# EAGLE design DuressBadge (EAGLE 9.6.2)
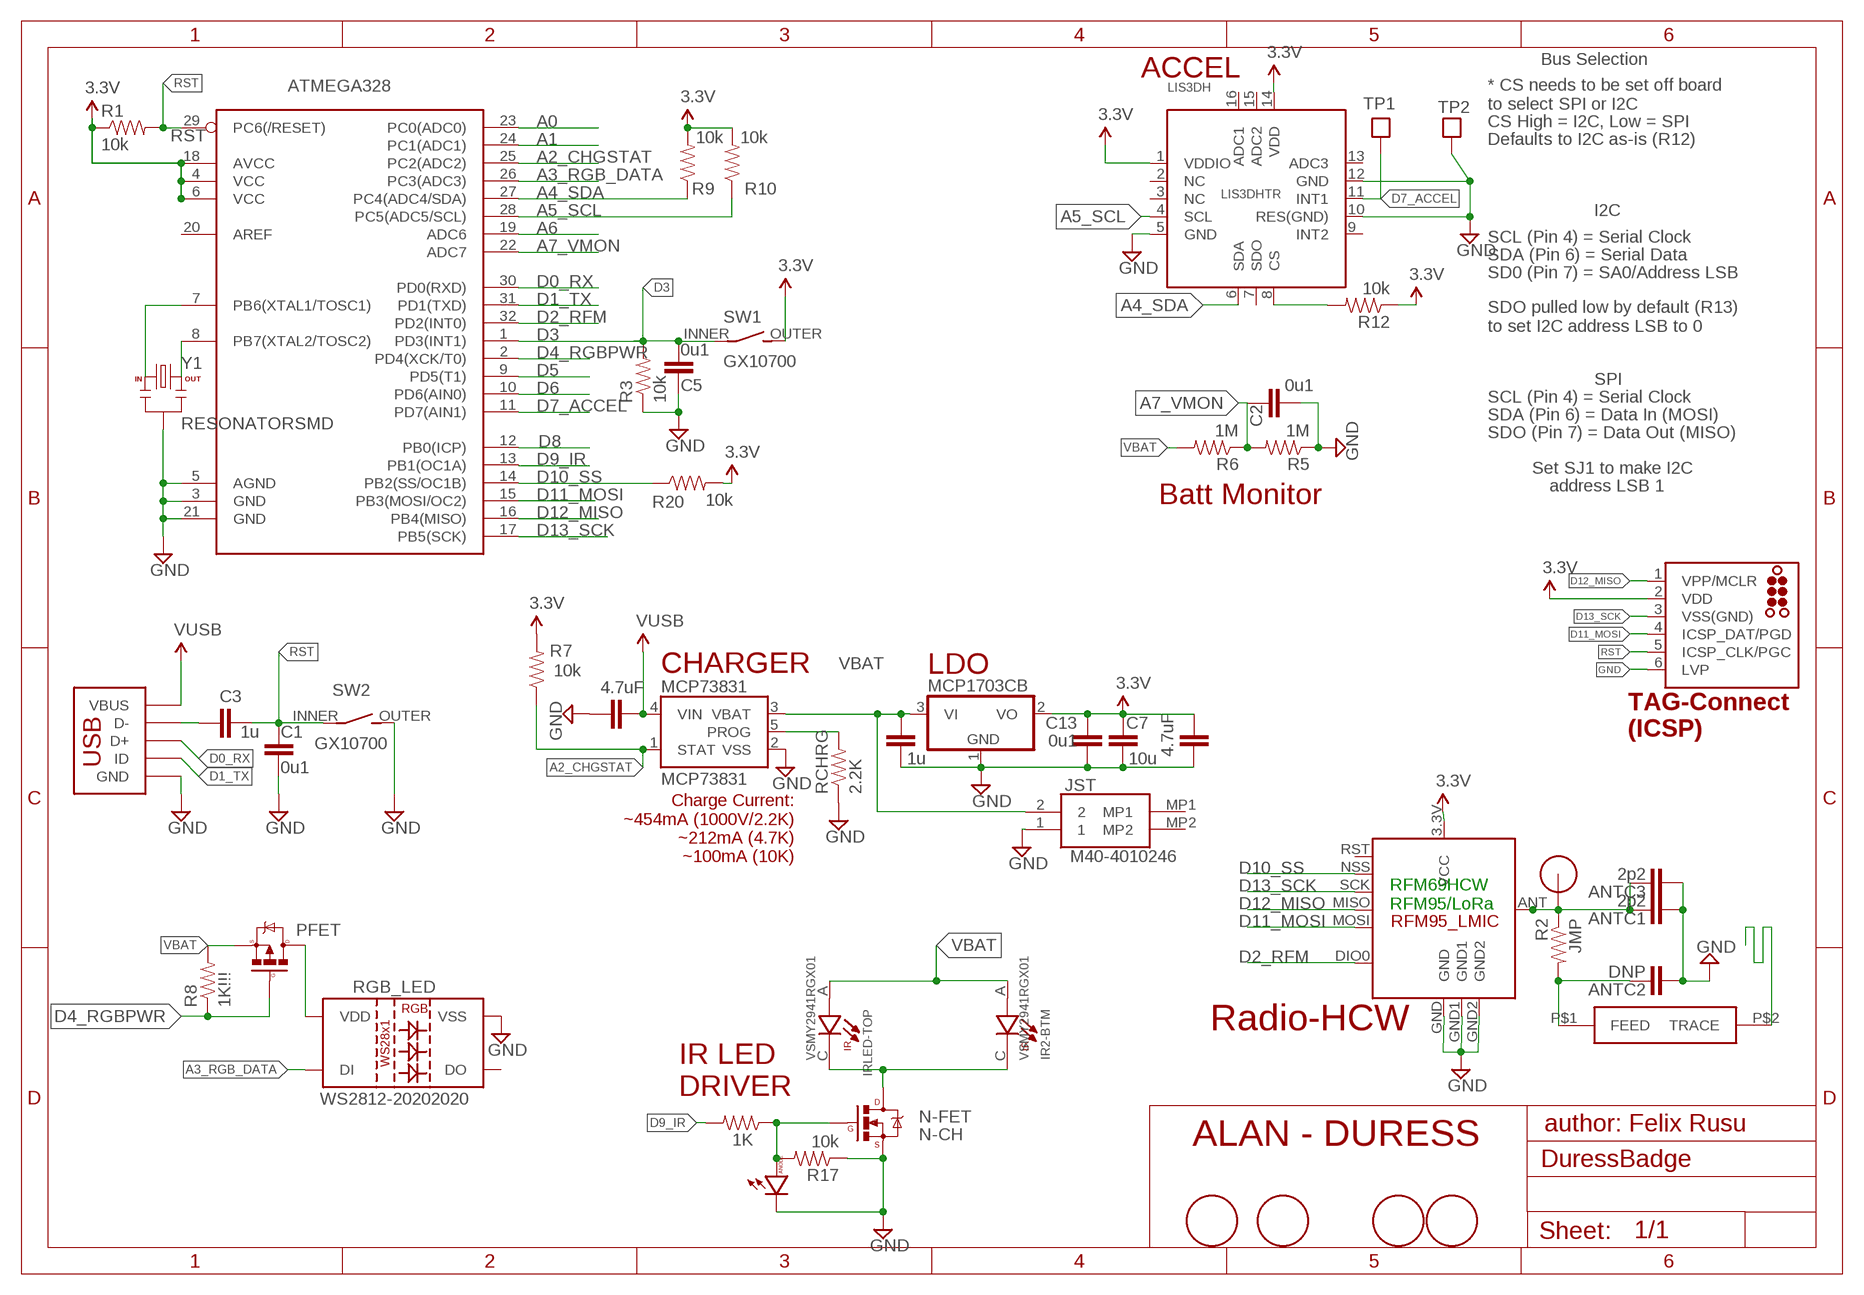
[diagram p0: schematic, sheet 1]

## Parts
ANTC1  2p2  CAP0603-CAP  [0603-CAP]
ANTC2  DNP  CAP0402-CAP  [0402-CAP]
ANTC3  2p2  CAP0402-CAP  [0402-CAP]
ATMEGA328  ATMega-328  ATMEGA168/328TQFP32  [TQFP32-08]
BR_FIDUCIAL  FIDUCIAL1.5MM  [FIDUCIAL_1.5MM]
C1  0u1  CAP0603-CAP  [0603-CAP]
C2  0u1  CAP0603-CAP  [0603-CAP]
C3  1u  CAP0603-CAP  [0603-CAP]
C4  4.7uF  CAP0603-CAP  [0603-CAP]
C5  0u1  CAP0603-CAP  [0603-CAP]
C7  10u  CAP0805-CAP  [0805-CAP]
C8  4.7uF  CAP0603-CAP  [0603-CAP]
C13  0u1  CAP0603-CAP  [0603-CAP]
C14  1u  CAP0603-CAP  [0603-CAP]
FIDUCIAL_BOTTOMRIGHT  FIDUCIALSQ  [FIDUCIAL_1.5MM_SQ]
FIDUCIAL_TOPLEFT  FIDUCIALSQ  [FIDUCIAL_1.5MM_SQ]
IR2-BTM  VSMY2941RGX01  [DIO_VSMY2941RGX01]
IRLED-TOP  VSMY2941RGX01  [DIO_VSMY2941RGX01]
JST  M40-4010246  [M404010246]
LDO  MCP1703CB  [SOT23]
LED_D9_DNP  LED3MM  [LED3MM]
LIS3DH  LIS3DHTR  ACCEL_LIS3DHTR  [LGA16_3X3MM]
MCP73831  MCP73831  [SOT23-5]
N-FET  N-CH  MOSFET-NCHANNEL  [SOT23-3]
PFET  MOSFET-PCHANNELSMD  [SOT23-3]
R1  10k  RESISTOR0603-RES  [0603-RES]
R2  JMP  RESISTOR0402-RES  [0402-RES]
R3  10k  RESISTOR0603-RES  [0603-RES]
R4  1K  RESISTOR0603-RES  [0603-RES]
R5  1M  RESISTOR0603-RES  [0603-RES]
R6  1M  RESISTOR0603-RES  [0603-RES]
R7  10k  RESISTOR0603-RES  [0603-RES]
R8  1K!!!  RESISTOR0603-RES  [0603-RES]
R9  10k  RESISTOR0603-RES  [0603-RES]
R10  10k  RESISTOR0603-RES  [0603-RES]
R12  10k  RESISTOR0603-RES  [0603-RES]
R17  10k  RESISTOR0603-RES  [0603-RES]
R20  10k  RESISTOR0603-RES  [0603-RES]
RCHRG  2.2K  RESISTOR0603-RES  [0603-RES]
RGB_LED  WS2812-20202020  [WS2812-2020]
SW1  GX10700  [GX10700]
SW2  GX10700  [GX10700]
TAG-ICSP  TAG-Connect  TC2030_ICSP-MCP-NL  [TC2030-MCP-NL]
TL_FIDUCIAL  FIDUCIAL1.5MM  [FIDUCIAL_1.5MM]
TP1  PAD_OR_PIN_1TP  [PAD_1_TESTPOINT]
TP2  PAD_OR_PIN_1TP  [PAD_1_TESTPOINT]
U$1  RFM12B_ANTENNA  [ANTENNA_THRUHOLE]
U$5  JOHANSON0900AT43A0070  [JOHANSON0900AT43A0070]
U$11  RFM95_WITHRST  [RFM95_LONGER_WITHRST]
USB_TOP  USB_5PINSLOTS_HOLES  [USB-B-MICRO_5PADS_SLOTS_HOLES]
Y1  RESONATORSMD  [RESONATOR-SMD]

## Nets
A0: ATMEGA328.23(PC0(ADC0))
A1: ATMEGA328.24(PC1(ADC1))
A2_CHGSTAT: ATMEGA328.25(PC2(ADC2)) MCP73831.1(STAT) R7.1
A3_RGB_DATA: ATMEGA328.26(PC3(ADC3)) RGB_LED.3(DI)
A4_SDA: ATMEGA328.27(PC4(ADC4/SDA)) LIS3DH.6(SDA) R9.1
A5_SCL: ATMEGA328.28(PC5(ADC5/SCL)) LIS3DH.4(SCL) R10.1
A6: ATMEGA328.19(ADC6)
A7_VMON: ATMEGA328.22(ADC7) C2.1 R5.2 R6.1
ANT: ANTC1.2 ANTC3.2 R2.1 U$1.P$1 U$11.ANT
D0_RX: ATMEGA328.30(PD0(RXD)) USB_TOP.D+
D1_TX: ATMEGA328.31(PD1(TXD)) USB_TOP.ID
D2_RFM: ATMEGA328.32(PD2(INT0)) U$11.DIO0
D3: ATMEGA328.1(PD3(INT1)) C5.2 R3.2 SW1.INNER(P)
D4_RGBPWR: ATMEGA328.2(PD4(XCK/T0)) PFET.1(G) R8.1
D5: ATMEGA328.9(PD5(T1))
D6: ATMEGA328.10(PD6(AIN0))
D7_ACCEL: ATMEGA328.11(PD7(AIN1)) LIS3DH.11(INT1) TP1.TP
D8: ATMEGA328.12(PB0(ICP))
D9_IR: ATMEGA328.13(PB1(OC1A)) R4.2
D10_SS: ATMEGA328.14(PB2(SS/OC1B)) R20.1 U$11.NSS(SEL)
D11_MOSI: ATMEGA328.15(PB3(MOSI/OC2)) TAG-ICSP.4(ICSP_DAT/PGD) U$11.MOSI
D12_MISO: ATMEGA328.16(PB4(MISO)) TAG-ICSP.1(VPP/MCLR) U$11.MISO
D13_SCK: ATMEGA328.17(PB5(SCK)) TAG-ICSP.3(VSS(GND)) U$11.SCK
DTR1: C3.1 USB_TOP.D-
GND [power]: ANTC1.1 ANTC2.1 ANTC3.1 ATMEGA328.3(GND) ATMEGA328.5(AGND) ATMEGA328.21(GND) C1.1 C2.2 C4.1 C5.1 C7.2 C8.1 C13.2 C14.2 JST.1 LDO.1(GND) LED_D9_DNP.MINUS LIS3DH.5(GND) LIS3DH.10(RES(GND)) LIS3DH.12(GND) MCP73831.2(VSS) N-FET.2(S) R3.1 R5.1 R17.1 RCHRG.1 RGB_LED.2(VSS) SW2.OUTER(S) TAG-ICSP.6(LVP) TP2.TP U$11.GND U$11.GND1 U$11.GND2 USB_TOP.GND USB_TOP.MT5(GND) USB_TOP.MT6(GND) USB_TOP.MT7(GND) USB_TOP.MT8(GND) USB_TOP.P$1(GND) USB_TOP.P$3(GND) USB_TOP.P$4(GND) USB_TOP.P$5(GND) USB_TOP.P$6(GND) USB_TOP.P$7(GND) Y1.XTAL2_GND
N$1: ATMEGA328.7(PB6(XTAL1/TOSC1)) Y1.XTAL1_IN
N$2: IR2-BTM.C IRLED-TOP.C N-FET.3(D)
N$3: MCP73831.5(PROG) RCHRG.2
N$4: U$5.P$2(TRACE)
N$5: PFET.3(D) RGB_LED.4(VDD)
N$6: LED_D9_DNP.PLUS N-FET.1(G) R4.1 R17.2
N$10: ANTC2.2 R2.2 U$5.P$1(FEED)
N$11: LIS3DH.8(CS) R12.2
N$21: ATMEGA328.8(PB7(XTAL2/TOSC2)) Y1.XTAL3_OUTPUT(XTAL3_OUT)
RST: ATMEGA328.29(PC6(/RESET)) C1.2 C3.2 R1.2 SW2.INNER(P) TAG-ICSP.5(ICSP_CLK/PGC)
VBAT: C14.1 IR2-BTM.A IRLED-TOP.A JST.2 LDO.3(VI) MCP73831.3(VBAT) PFET.2(S) R6.2 R8.2
VCC: ATMEGA328.4(VCC) ATMEGA328.6(VCC) ATMEGA328.18(AVCC) C4.2 C7.1 C13.1 LDO.2(VO) LIS3DH.1(VDDIO) LIS3DH.14(VDD) R1.1 R7.2 R9.2 R10.2 R12.1 R20.2 SW1.OUTER(S) TAG-ICSP.2(VDD) U$11.3.3V(VCC) ; supply symbol labelled 3.3V
VUSB: C8.2 MCP73831.4(VIN) USB_TOP.VBUS
Unconnected: ATMEGA328.20(AREF) BR_FIDUCIAL.P$1(FIDUCIAL) FIDUCIAL_BOTTOMRIGHT.P$1(FIDUCIAL) FIDUCIAL_TOPLEFT.P$1(FIDUCIAL) JST.MP1 JST.MP2 LIS3DH.2(NC) LIS3DH.3(NC) LIS3DH.7(SDO) LIS3DH.9(INT2) LIS3DH.13(ADC3) LIS3DH.15(ADC2) LIS3DH.16(ADC1) RGB_LED.1(DO) TL_FIDUCIAL.P$1(FIDUCIAL) U$11.RST

## Notes on the sheet
- ACCEL
- Bus Selection
- * CS needs to be set off board
  to select SPI or I2C
- CS High = I2C, Low = SPI
- Defaults to I2C as-is (R12)
- I2C
- SCL (Pin 4) = Serial Clock
- SDA (Pin 6) = Serial Data
- SD0 (Pin 7) = SA0/Address LSB
- SDO pulled low by default (R13)
  to set I2C address LSB to 0
- SPI
- SCL (Pin 4) = Serial Clock
- SDA (Pin 6) = Data In (MOSI)
- SDO (Pin 7) = Data Out (MISO)
- Set SJ1 to make I2C
- Batt Monitor
- address LSB 1
- CHARGER
- TAG-Connect
  (ICSP)
- Charge Current:
  ~454mA (1000V/2.2K)
  ~212mA (4.7K)
  ~100mA (10K)
- RFM69HCW
  RFM95/LoRa
- Radio-HCW
- IR LED
  DRIVER
- author: Felix Rusu
- ALAN - DURESS

## Library data of the parts
ANTC1-ANTC3 C1-C5 C7 C8 C13 C14 = LowPowerLab:CAP: Capacitor Standard 0603 ceramic capacitor, and 0.1" leaded capacitor.
ATMEGA328 = LowPowerLab:ATMEGA168/328: Atmel 32-pin 8-bit micro, 16k flash.
BR_FIDUCIAL FIDUCIAL_BOTTOMRIGHT FIDUCIAL_TOPLEFT TL_FIDUCIAL = LowPowerLab:FIDUCIAL
IR2-BTM IRLED-TOP = VSMY2941RGX01:VSMY2941RGX01: Infrared Emitters - High Power IR Emtr 940nm; 5ns 160mW/sr; rev-gwing Check availability <https://pricing.snapeda.com/parts/VSMY2941RGX01/Vishay%20Semiconductor/view-part?ref=eda>; AVAILABILITY: In Stock; CHECK_PRICES: https://www.snapeda.com/parts/VSMY2941RGX01/Vishay+Semiconductor+Opto+Division/view-part/?ref=eda; DESCRIPTION: IR Emitter: 940nm, SMD, 160mW/sr, +/-8degrees; MF: Vishay Semiconductor; MP: VSMY2941RGX01; PACKAGE: SMD-2 Vishay Semiconductor; PRICE: None; PURCHASE-URL: https://www.snapeda.com/api/url_track_click_mouser/?unipart_id=3622774&manufacturer=Vishay Semiconductor&part_name=VSMY2941RGX01&search_term=None; SNAPEDA_LINK: https://www.snapeda.com/parts/VSMY2941RGX01/Vishay+Semiconductor+Opto+Division/view-part/?ref=snap
JST = M40-4010246:M40-4010246: Headers & Wire Housings 2P SIL SMT HORIZ SHROUDED TAB HEADER Source: Datasheet <https://componentsearchengine.com/Datasheets/2/M40-4010246.pdf>; DESCRIPTION: Headers & Wire Housings 2P SIL SMT HORIZ SHROUDED TAB HEADER; HEIGHT: 3.15mm; MANUFACTURER_NAME: Harwin; MANUFACTURER_PART_NUMBER: M40-4010246; MOUSER_PART_NUMBER: 855-M40-4010246; MOUSER_PRICE-STOCK: https://www.mouser.co.uk/ProductDetail/Harwin/M40-4010246?qs=%252Bk6%2F5FB6qrkoTdPFThSz5A%3D%3D
LDO = linear:MCP1703: 250 mA, 16V, Low Quiescent Current LDO Regulator Source: http://ww1.microchip.com/downloads/en/DeviceDoc/22049b.pdf
LED_D9_DNP = LowPowerLab:LED
LIS3DH = microbuilder:ACCEL_LIS3DHTR: LIS3DHTR 3-Axis Accelerometer with I2C/SPI Interface VDD: 1.71-3.6V VDDIO: 1.71-VDD+0.1V Scale: +/-2g, 4g, 8g, 16g with 16--bit data output Temp:: -40°C - 85°C Mouser: 511-LIS3DHTR Digikey: 497-10613-1-ND
MCP73831 = SparkFun-PowerIC:MCP73831: Miniature single cell, fully integrated Li-Ion, Li-polymer charge management controller http://ww1.microchip.com/downloads/en/DeviceDoc/20001984g.pdf IC-09995; PROD_ID: IC-09995
N-FET = LowPowerLab:MOSFET-NCHANNEL: Generic PMOSFET
PFET = LowPowerLab:MOSFET-PCHANNEL: Generic PMOSFET
R1-R10 R12 R17 R20 RCHRG = LowPowerLab:RESISTOR: Resistor Basic schematic elements and footprints for 0603, 1206, and PTH resistors.
RGB_LED = LowPowerLab:WS2812-2020
SW1 SW2 = snaptron_Alan:GX10700
TAG-ICSP = tag-connect:TC2030_ICSP: TAG-CONNECT ICSP Connector Manufacturer: Tag-Connect <http://www.tag-connect.com> Cable for easy In-Circuit Serial Programming. Designed for Microchip ICD2, suitable for many others. Two variants - one "with legs" (for hands-free fit on PCB) and another "without legs" for quick programming. PAD Description 1 MCLR/Vpp 2 Vdd 3 GND 4 PGD (ISPDAT) 5 PGC (ISPCLK) 6 nc (used for LVP) ©2009 ROFA.cz - modified and updated by Robert Darlington ‹rdarlington@gmail.com›
TP1 TP2 = LowPowerLab:PAD_OR_PIN_1
U$1 = LowPowerLab:RFM12B_ANTENNA
U$5 = Kris:JOHANSON0900AT43A0070: Johanson dual wide band antenna http://www.mouser.com/new/Johanson/johanson-0900at43a0070/
U$11 = LowPowerLab:RFM95_WITHRST
USB_TOP = LowPowerLab:USB_5PIN
Y1 = LowPowerLab:RESONATOR: Resonator Small SMD resonator. This is the itty bitty 10/20MHz resonators with built in caps. CSTCE10M0G55 and CSTCE20M0V53. Footprint has been reviewed closely but hasn't been tested yet.

## Net classes
1 power: width 0.381 mm, clearance 0.254 mm

## Board
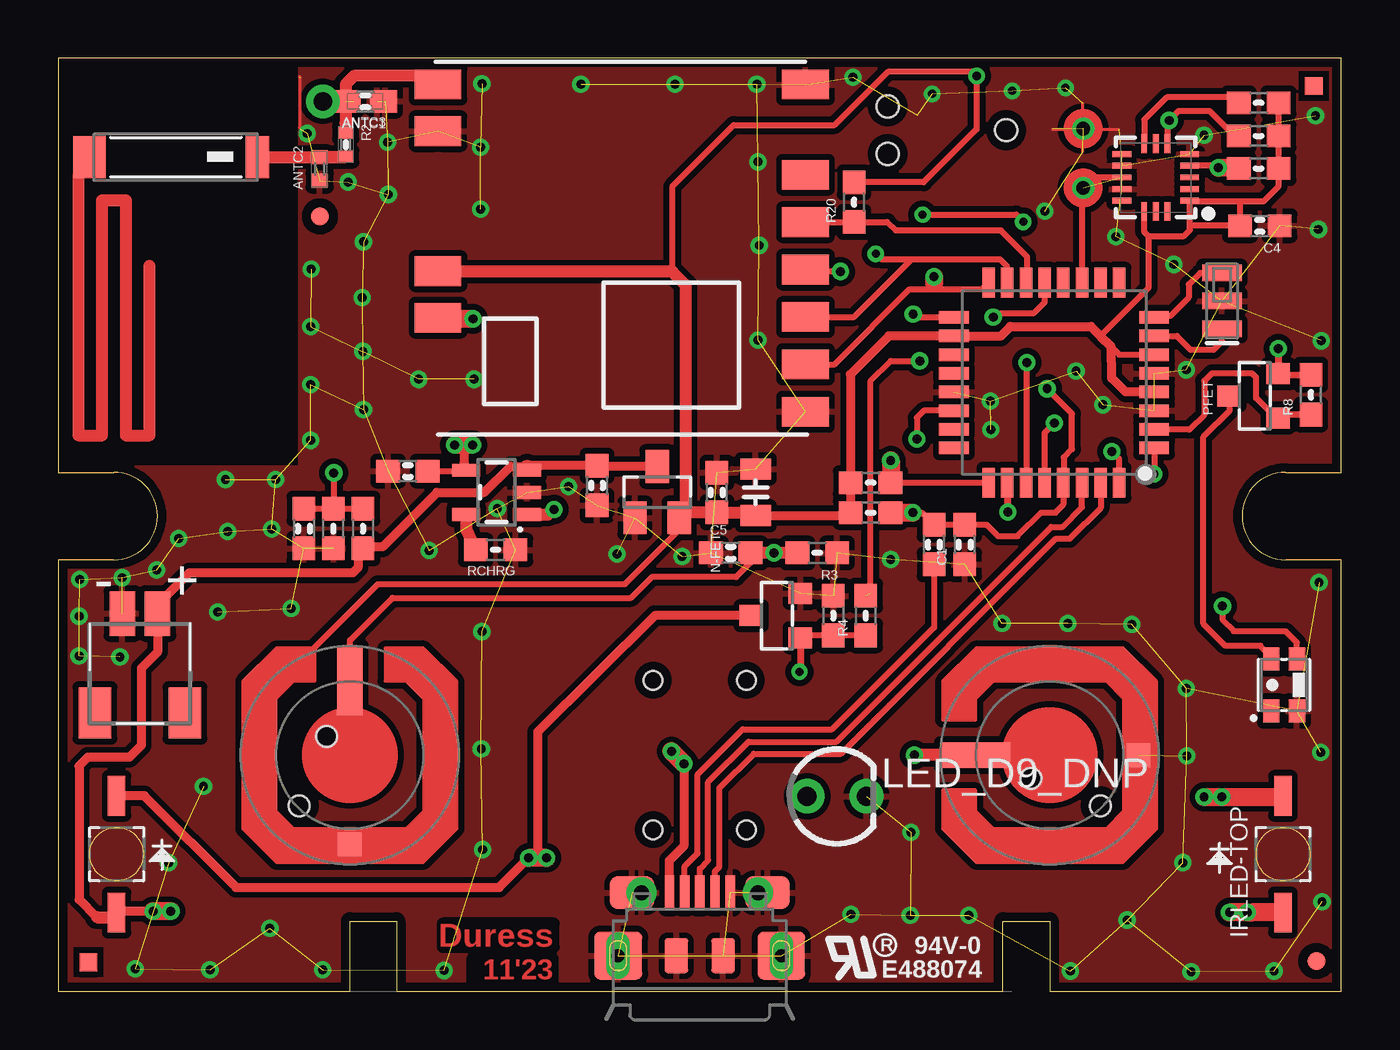
[diagram p1: board, top side]
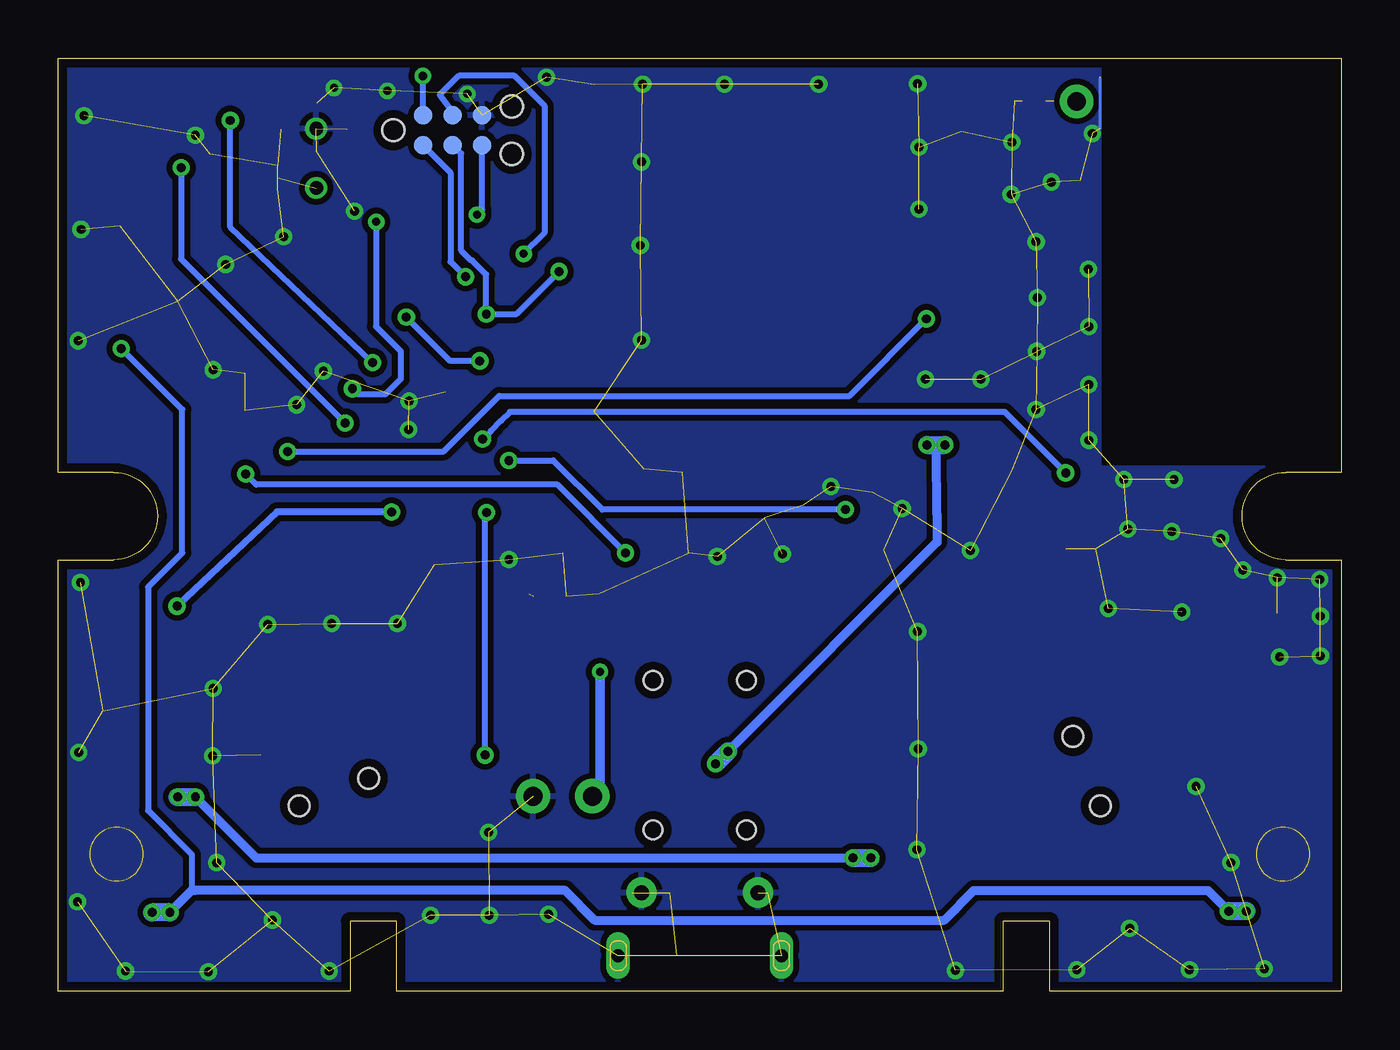
[diagram p2: board, bottom side, seen from below]

Size 55 x 40 mm. Coordinates in mm from the lower left corner, seen from the top.
Outline: 23.64,1.15 23.64,1.9 arc-99 24.05,2.15 24.07,2.15 arc-70 24.34,1.93 24.35,1.9 24.35,1.15 arc-99 23.94,0.89 23.92,0.89 arc-75 23.64,1.15
Outline: 30.64,1.15 30.64,1.9 arc-99 31.05,2.15 31.07,2.15 arc-70 31.34,1.93 31.35,1.9 31.35,1.15 arc-99 30.94,0.89 30.92,0.89 arc-75 30.64,1.15
Outline: 0,40 0,22.25 2.38,22.25 arc-180 2.38,18.5 0,18.5 0,0 12.5,0 12.5,3 14.5,3 14.5,0 40.5,0 40.5,3 42.5,3 42.5,0 55,0 55,18.5 52.62,18.5 arc-180 52.62,22.25 55,22.25 55,40 0,40
Copper layers (1*16): Top 0.035mm / dielectric 0.93mm / Bottom 0.035mm
Design rules "default *": minimum track width 6mil, minimum drill 13mil, track to track 8mil, track to pad 8mil, pad to pad 6mil, via to via 6mil, smd to smd 0mil, copper to edge 15mil, drill to drill 6mil, minimum pad ring 7mil, minimum via ring 7mil, stop-mask expansion 4mil, vias tented up to drill 28mil, thermal gap 10mil
Holes 0.8 mm at 25.5,6.92 29.5,6.92 25.5,13.33 29.5,13.33
tRestrict: area 0.1,22.6 to 10.3,39.9; area 31.6,24 to 32.4,25.7; area 31.5,38 to 32.4,38.4; area 15.9,36 to 16.6,37.7; area 10.6,34.6 to 11.8,34.9
bRestrict: area 0.1,22.6 to 10.3,39.9

### Footprints (pad centres in the part's own frame; a part is rotated, then mirrored left to right if it is on the bottom)
0603-CAP = smd 1.016 x 0.965: 1 -0.85,0; 2 0.85,0
0402-CAP = smd 0.6 x 0.7: 1 -0.5,0; 2 0.5,0
TQFP32-08 = smd 1.27 x 0.533: 1 -4.293,2.8; 2 -4.293,2; 3 -4.293,1.2; 4 -4.293,0.4; 5 -4.293,-0.4; 6 -4.293,-1.2; 7 -4.293,-2; 8 -4.293,-2.8; 17 4.293,-2.8; 18 4.293,-2; 19 4.293,-1.2; 20 4.293,-0.4; 21 4.293,0.4; 22 4.293,1.2; 23 4.293,2; 24 4.293,2.8 | smd 0.533 x 1.27: 9 -2.8,-4.293; 10 -2,-4.293; 11 -1.2,-4.293; 12 -0.4,-4.293; 13 0.4,-4.293; 14 1.2,-4.293; 15 2,-4.293; 16 2.8,-4.293; 25 2.8,4.293; 26 2,4.293; 27 1.2,4.293; 28 0.4,4.293; 29 -0.4,4.293; 30 -1.2,4.293; 31 -2,4.293; 32 -2.8,4.293
FIDUCIAL_1.5MM = smd 0.762 x 0.762: P$1 0,0
0805-CAP = smd 0.902 x 1.3: 1 -1,0; 2 1,0
FIDUCIAL_1.5MM_SQ = smd 0.762 x 0.762: P$1 0,0
DIO_VSMY2941RGX01 = smd 1.7 x 0.75: A -2.5,0; C 2.5,0
M404010246 = smd 1.1 x 1.9: 1 -0.754,2.415; 2 0.754,2.415 | smd 1.4 x 2.2: MP1 1.927,-1.841; MP2 -1.927,-1.841
SOT23 = smd 1 x 1.4: 1 -0.95,-1.1; 2 0.95,-1.1; 3 0,1.1
LED3MM = drill 0.813 pad 1.473: MINUS 1.27,0; PLUS -1.27,0
LGA16_3X3MM = smd 0.8 x 0.25: 1 -1.45,1; 2 -1.45,0.5; 3 -1.45,0; 4 -1.45,-0.5; 5 -1.45,-1; 9 1.45,-1; 10 1.45,-0.5; 11 1.45,0; 12 1.45,0.5; 13 1.45,1 | smd 0.25 x 0.8: 6 -0.5,-1.45; 7 0,-1.45; 8 0.5,-1.45; 14 0.5,1.45; 15 0,1.45; 16 -0.5,1.45
SOT23-5 = smd 0.55 x 1.2: 1 -0.95,-1.3; 2 0,-1.3; 3 0.95,-1.3; 4 0.95,1.3; 5 -0.95,1.3
SOT23-3 = smd 0.9 x 1: 1 -0.95,-1; 2 0.95,-1; 3 0,1.1
0603-RES = smd 1.016 x 0.965: 1 -0.85,0; 2 0.85,0
0402-RES = smd 0.508 x 0.66: 1 -0.508,0; 2 0.508,0
WS2812-2020 = smd 1 x 0.7: 1 1.115,-0.55; 2 1.115,0.55; 3 -1.115,0.55; 4 -1.115,-0.55
GX10700 = smd 3 x 1.1: INNER 3.2,0 | smd 1 x 1: OUTER -3.815,0 | hole 0.89: 0.8,1; -2.173,2.173
TC2030-MCP-NL = smd 0.787 x 0.787: 1 1.27,-0.635; 2 1.27,0.635; 3 2.54,-0.635; 4 2.54,0.635; 5 3.81,-0.635; 6 3.81,0.635 | hole 0.94: 0,0; 5.08,-1.016; 5.08,1.016
PAD_1_TESTPOINT = drill 0.584: TP 0,0
ANTENNA_THRUHOLE = drill 0.8 pad 1.422: P$1 0,0
JOHANSON0900AT43A0070 = smd 1 x 1.8: P$1 -3.5,0 | smd 1.4 x 1.8: P$2 3.7,0
RFM95_LONGER_WITHRST = smd 2 x 1.27: 3.3V 7.651,1; ANT 7.651,-7; DIO0 7.651,3; GND 7.651,-5; GND1 -8.107,-7; GND2 -8.107,7.032; MISO -8.107,5; MOSI -8.107,2.968; NSS -8.107,-1.096; RST -8.107,-3.128; SCK -8.107,0.936
USB-B-MICRO_5PADS_SLOTS_HOLES = smd 0.4 x 1.5: D+ 0,2.701; D- -0.65,2.701; GND 1.3,2.701; ID 0.65,2.701; VBUS -1.3,2.701 | smd 2.05 x 2.05: MT5 -3.5,0 | smd 2.032 x 2.05: MT6 3.5,0 | smd 1.9 x 1.4: MT7 -2.9,2.7; MT8 2.9,2.7 | drill 0.55 pad 1.016 long: P$1 -3.5,0; P$3 3.5,0 | smd 1 x 1.5: P$4 1,0; P$7 -1,0 | drill 0.65 pad 1.3: P$5 -2.5,2.7; P$6 2.5,2.7
RESONATOR-SMD = smd 0.7 x 1.7: XTAL1_IN -1.2,0; XTAL2_GND 0,0; XTAL3_OUTPUT 1.2,0

### Placement (x,y rotation side)
ANTC1  13.16,38.15 180 top
ANTC2  11.2,35.26 90 top
ANTC3  13.16,38.15 180 top
ATMEGA328  42.69,26.09 180 top
BR_FIDUCIAL  53.93,1.29 0 top
C1  38.86,19.15 90 top
C2  10.53,19.84 270 top
C3  37.54,19.15 90 top
C4  51.51,32.82 180 top
C5  28.83,18.8 0 top
C7  29.9,21.39 90 top
C8  14.99,22.3 0 top
C13  28.23,21.38 90 top
C14  23.1,21.68 270 top
FIDUCIAL_BOTTOMRIGHT  53.82,38.81 0 top
FIDUCIAL_TOPLEFT  1.3,1.24 0 top
IR2-BTM  2.5,5.88 90 top
IRLED-TOP  52.5,5.88 90 top
JST  3.5,13.78 0 top
LDO  25.67,21.39 0 top
LED_D9_DNP  33.38,8.36 0 top
LIS3DH  47.05,34.89 180 top
MCP73831  18.79,21.39 90 top
N-FET  30.81,16.1 90 top
PFET  51.29,25.53 90 top
R1  34.82,20.52 0 top
R2  12.32,36.3 270 top
R3  32.54,18.8 180 top
R4  34.62,16.1 90 top
R5  11.8,19.84 90 top
R6  13.07,19.84 270 top
R7  34.82,21.81 180 top
R8  53.71,25.58 90 top
R9  51.46,36.67 0 top
R10  51.46,35.27 0 top
R12  51.46,38.09 180 top
R17  33.22,16.1 270 top
R20  34.11,33.83 90 top
RCHRG  18.75,18.92 180 top
RGB_LED  52.55,13.13 270 top
SW1  12.5,10.12 90 top
SW2  42.5,10.12 180 top
TAG-ICSP  40.64,36.92 0 bottom
TL_FIDUCIAL  11.22,33.22 0 top
TP1  43.94,34.44 0 top
TP2  43.94,36.98 0 top
U$1  11.34,38.15 90 top
U$5  5.03,35.76 180 top
U$11  23.93,31.88 180 top
U$31  [LOGO_UL_XSMALL_PCBWAY]  32.95,0.53 0 top
USB_TOP  27.5,1.52 0 top
Y1  49.89,29.59 90 top

### Tracks (layer width: path | path; a pad name or v marks a point on that pad's centre or on a via)
A2_CHGSTAT  (via drill 0.38)
  Top 0.254: ATMEGA328.25 35.68,21.8
  Top 0.508: MCP73831.1 21,20.44 v21.26,20.65
  Top 0.762: v35.69,22.76 35.69,21.8 35.68,21.8 R7.1
  Bottom 0.254: v21.26,20.65 31.67,20.65 33.78,22.76 v35.69,22.76
A3_RGB_DATA  (via drill 0.38)
  Top 0.254: v49.91,16.51 49.91,15.93 50.39,15.44 52.6,15.44 53.1,14.95 RGB_LED.3
  Top 0.305: ATMEGA328.26 40.69,20.58 v40.72,20.55
  Bottom 0.305: v40.72,20.55 45.62,20.55 v49.91,16.51
A4_SDA  (via drill 0.38)
  Top 0.254: ATMEGA328.27 41.53,21.84 v41.53,26.95 | LIS3DH.6 47.55,37.26 v47.62,37.34 48.03,37.74 49.35,37.74 50.43,36.67 R9.1
  Bottom 0.254: v41.53,26.95 47.62,32.77 v47.62,37.34
A5_SCL  (via drill 0.38)
  Top 0.254: ATMEGA328.28 42.29,23.95 v42.7,24.36 | v49.73,35.31 49.62,35.39 LIS3DH.4 | R10.1 50.3,35.29
  Top 0.762: 50.3,35.29 v49.73,35.31
  Bottom 0.254: v42.7,24.36 49.73,31.39 v49.73,35.31
A7_VMON  (via drill 0.38)
  Top 0.254: C2.1 R5.2 | R5.2 R6.1 | v11.81,22.23 11.81,20.7 R5.2 | ATMEGA328.22 37.11,24.89 36.8,24.59 v36.8,23.67
  Bottom 0.254: v36.8,23.67 36.45,24.03 36.02,24.46 35.64,24.84 14.43,24.84 v11.81,22.23
ANT  (1 unrouted)
  Top 0.508: ANTC1.2 12.31,37.22 R2.1 | U$11.ANT 15.88,38.88 15.52,39.24 12.68,39.24 12.32,38.89 12.32,38.16 ANTC1.2 | ANTC1.2 U$1.P$1
D0_RX
  Top 0.254: USB_TOP.D+ 27.5,5.25 27.86,5.61 27.86,8.97 29.59,10.69 33.35,10.69 42.57,19.91 43.05,19.91 43.89,20.75 ATMEGA328.30
D1_TX
  Top 0.254: USB_TOP.ID 28.15,5.14 28.35,5.33 28.35,8.71 29.82,10.19 33.55,10.19 42.77,19.41 43.37,19.41 44.69,20.73 ATMEGA328.31
D2_RFM  (via drill 0.38)
  Top 0.254: 16.32,28.83 U$11.DIO0 | ATMEGA328.32 45.49,22.81 v45.16,23.14
  Top 0.762: 16.32,28.83 v17.78,28.83
  Bottom 0.254: v45.16,23.14 38.48,23.14 36.09,25.53 21.08,25.53 v17.78,28.83
D3  (via drill 0.38)
  Top 0.254: SW1.INNER 12.5,15.04 14.33,16.87 24.56,16.87 25.45,17.75 29.06,17.75 29.68,18.38 C5.2 | ATMEGA328.1 46.98,22.19 v46.97,22.17
  Top 0.508: R3.2 v30.68,18.8 C5.2
  Bottom 0.254: v30.68,18.8 33.6,21.72 46.51,21.72 v46.97,22.17
D4_RGBPWR
  Top 0.254: PFET.1 52.21,24.58 51.36,25.43 51.36,26.31 51.18,26.49 49.45,26.49 49.12,26.16 49.12,24.71 48.49,24.08 46.99,24.08 ATMEGA328.2
  Top 0.305: R8.1 52.42,24.7 PFET.1
D7_ACCEL  (1 unrouted)
  Top 0.254: LIS3DH.11 44.24,34.89 43.89,34.54 ATMEGA328.11
D9_IR  (via drill 0.38)  (1 unrouted)
  Top 0.254: ATMEGA328.13 42.29,29.54 41.83,29.08 40.26,29.08 v40.08,28.91 | 34.82,17.03 34.82,26.16 35.69,27.03 v36.93,27.03
  Bottom 0.254: v36.93,27.03 38.2,27.03 v40.08,28.91
D10_SS
  Top 0.254: U$11.NSS 34.1,32.97 R20.1 35.53,32.98 35.9,32.61 40.41,32.61 41.53,31.5 41.53,30.43 ATMEGA328.14
D11_MOSI  (via drill 0.35)
  Top 0.254: U$11.MOSI 34.12,28.91 36.58,31.37 | 36.58,31.37 38.86,31.37 40.39,31.37 40.69,31.07 ATMEGA328.15 | 36.58,31.37 35.31,31.37 v35.05,31.62
  Bottom 0.254: v35.05,31.62 34.16,32.51 34.16,37.97 35.43,39.24 37.84,39.24 38.65,38.44 38.1,37.68 TAG-ICSP.4
D12_MISO  (via drill 0.38)
  Top 0.254: U$11.MISO 33.28,26.88 36.5,30.1 37.57,30.1 | 37.57,30.1 39.6,30.1 ATMEGA328.16 | 37.54,30.35 37.54,30.12 37.57,30.1
  Top 0.762: v37.54,30.63 37.54,30.35
  Bottom 0.254: v37.54,30.63 38.19,31.28 38.19,35.1 TAG-ICSP.1
D13_SCK  (via drill 0.38)
  Top 0.254: ATMEGA328.17 36.77,28.89 v36.65,29.03 | v33.53,30.86 32.11,30.86 U$11.SCK
  Bottom 0.254: v33.53,30.86 35.36,29.03 v36.65,29.03 36.65,30.73 37.25,31.33 37.3,31.33 37.73,31.76 37.73,35.92 TAG-ICSP.3
DTR1
  Top 0.254: USB_TOP.D- 26.85,5.36 27.41,5.92 27.41,9.3 29.34,11.23 33.17,11.23 37.54,15.6 C3.1
GND  (via drill 0.35, 0.38)  (131 unrouted)
  Top 0.127: 10.34,39.22 10.34,37.03 | 42.62,36.96 45.47,36.96 | 43.92,35.99 43.92,38.08
  Bottom 0.127: 10.34,39.17 10.34,36.98
  other vias: 49.12,36.7 30,27.91 12.42,34.7 10.85,30.96 10.82,28.5 10.82,26.01 10.82,23.62 9.32,21.95 7.16,21.95 18.16,38.91 29.95,38.89 22.4,38.89 39.95,25.3 39.98,24.08 43.64,26.59 26.75,18.64 23.95,18.75 26.44,38.89 30.05,31.98 30,35.56 18.11,36.2 18.11,33.53 17.83,26.24 13.08,24.94 13.06,27.43 13.03,29.74 13.08,32.13 14.12,36.4 14.15,34.16 9.14,19.81 7.26,19.71 6.83,16.26 9.98,16.41 3.3,0.97 11.33,0.91 6.5,0.91 53.9,37.54 54.03,32.66 54.15,27.89 54.05,17.53 54.13,10.24 54.18,3.84 52.12,0.86 48.56,0.84 43.38,0.86 36.53,3.25 16.54,0.89 9.07,2.69 6.22,8.79 18.16,15.42 18.19,6.07 18.14,10.39 40.46,15.77 46.02,15.72 43.28,15.77 48.36,12.98 48.39,10.08 48.21,5.51 45.82,3.05 39.04,3.25 33.99,3.3 36.55,6.81 44.78,25.15 47.83,31.17 21.87,21.64 15.9,18.9 18.82,20.7 4.22,18.06 0.91,17.65 0.89,14.38 2.74,17.73 5.16,19.41 0.89,16.08 2.64,14.33 4.72,5.51 35.69,18.52 48.36,26.64 45.34,32.36 42.29,33.45 15.44,26.24 34.06,39.19 10.67,36.78 37.47,38.48 40.89,38.61 43.18,38.73
  pour Bottom: 0.02,0 55.02,0 54.98,40 0.02,40
  pour Top: 0.05,0 55,0 55.01,39.97 0.05,39.97
N$1
  Top 0.254: ATMEGA328.7 47.96,28.09 48.54,27.51 49.53,27.51 49.89,27.86 Y1.XTAL1_IN
N$2  (via drill 0.38)
  Top 0.381: IR2-BTM.C 3.68,8.38 7.62,4.45 18.9,4.45 v20.17,5.71 20.55,5.92 20.55,11.12 25.58,16.1 N-FET.3
  Top 0.508: IR2-BTM.C | 52.46,8.33 IRLED-TOP.C
  Top 0.762: v20.93,5.71 v20.17,5.71 | v49.12,8.33 v49.89,8.33 52.46,8.33
  Bottom 0.381: v20.93,5.71 46.51,5.71 v49.12,8.33
  Bottom 0.762: v20.93,5.71 v20.17,5.71 | v49.89,8.33 v49.12,8.33
N$3
  Top 0.508: MCP73831.5 17.49,19.79 RCHRG.2
N$5
  Top 0.254: PFET.3 50.22,25.5 50.22,24.89 49.1,23.77 49.1,15.75 50.04,14.81 51.54,14.81 52,14.34 RGB_LED.4
N$6  (via drill 0.35)
  Top 0.254: R4.1 R17.2 31.91,15.25 N-FET.1
  Top 0.305: N-FET.1 31.81,13.72 v31.77,13.69
  Bottom 0.406: v31.77,13.69 31.77,8.69 LED_D9_DNP.PLUS
N$7
  Top 0.508: 0.86,34.98 0.86,23.82 1.88,23.82
N$8
  Top 0.508: 1.88,23.82 1.88,33.91 2.9,33.91 2.9,23.82 3.91,23.82 3.91,31.09
N$10
  Top 0.508: 12.32,35.76 ANTC2.2 | U$5.P$1 12.32,35.76 | 12.32,35.76 R2.2
N$11
  Top 0.254: R12.2 50.48,38.09 50.24,38.33 47.52,38.33 46.56,37.36 46.56,36.35 LIS3DH.8
N$21
  Top 0.254: Y1.XTAL3_OUTPUT 48.95,30.79 48.46,30.3 48.46,29.74 47.68,28.96 47.05,28.96 ATMEGA328.8
RST  (via drill 0.35, 0.38)
  Top 0.254: v42.39,25.83 43.46,24.77 43.46,23.24 43.1,22.89 43.1,21.82 ATMEGA328.29 43.09,20.86 42.75,20.52 42.14,20.52 41.12,19.51 40.28,19.51 39.79,20 C1.2 C3.2 37.02,20.52 v36.64,20.52 | v37.05,33.3 41.07,33.3 v41.37,32.99
  Top 0.508: SW2.INNER v36.7,10.12
  Top 0.762: R1.2 v36.64,20.52
  Bottom 0.254: v42.39,25.83 42.16,25.6 40.97,25.6 40.31,26.26 40.31,27.43 41.38,28.5 v41.38,32.99 v41.37,32.99 | v36.7,10.12 36.7,20.46 v36.64,20.52 | v37.05,33.3 36.83,33.52 TAG-ICSP.5
VBAT  (via drill 0.38)
  Top 0.305: v52.3,27.56 PFET.2 52.37,26.4 R8.2
  Top 0.381: JST.2 4.25,14.54 3.56,13.84 3.56,10.54 3.05,10.03 1.27,10.03 0.89,9.65 0.89,3.94 1.65,3.17 | v4.06,3.43 2.55,3.43 | LDO.3 23.13,22.49 | C14.1 20.1,22.53 | 20.05,22.5 19.38,22.5 18.26,21.39 16.23,21.39 13.89,19.05 13.13,19.05 | 12.85,18.95 12.85,18.16 12.62,17.93 5.61,17.93 4.25,16.57
  Top 0.508: 1.65,3.17 2.3,3.17 IR2-BTM.A 2.55,3.43 | 51.16,3.38 v50.22,3.38 | 23.13,22.49 C14.1 | 20.1,22.53 MCP73831.3 20.05,22.5 | 13.13,19.05 R6.2 12.85,18.95 | JST.2 4.25,16.57
  Top 0.762: v4.83,3.43 v4.06,3.43 | v50.98,3.38 v50.22,3.38 | IRLED-TOP.A 51.16,3.38
  Bottom 0.254: 49.15,4.32 49.28,4.45 49.28,5.87 51.16,7.75 51.16,17.32 49.68,18.8 49.68,24.94 v52.3,27.56
  Bottom 0.381: v4.83,3.43 5.71,4.32 15.75,4.32 17.02,3.05 32,3.05 33.27,4.32 49.15,4.32 49.28,4.32 v50.22,3.38
  Bottom 0.762: v4.06,3.43 v4.83,3.43 | v50.22,3.38 v50.98,3.38
VCC  (via drill 0.35)
  Top 0.254: R12.1 52.31,37.55 R9.2 R10.2 52.31,34.51 51.66,33.86 48.53,33.86 LIS3DH.1 48.51,33.87 48.51,32.89 | LIS3DH.14 46.55,32.57 46.74,32.38 | 46.74,32.38 48.26,32.38 48.51,32.64 48.51,32.89 | 46.74,32.38 46.74,30.15 44.91,28.32 44.68,28.09 | LDO.2 26.62,19.79 24.28,17.45 13.69,17.45 10.74,14.5 10.74,14.17 10.62,14.05 9.75,14.05 8.66,12.95 8.66,7.32 9.65,6.33 12.48,6.33 SW1.OUTER | 45.17,27.29 45.16,27.3 45.14,27.64 45.48,27.29 ATMEGA328.6 | 29.77,20.4 C7.1 | C4.2 50.65,32.82 | 50.65,32.82 48.59,32.82 48.51,32.89 | 50.66,33.77 C4.2 50.65,32.82 | 26.31,30.86 26.31,34.49 28.96,37.13 33.28,37.13 35.56,39.42 39.2,39.42 v39.37,39.24 39.37,36.96 37.1,34.68 R20.2
  Top 0.381: ATMEGA328.4 45.76,25.69 45.16,26.29 45.14,27.64 44.68,28.09 44.27,28.5 40.82,28.5 40.41,28.09 ATMEGA328.18 35.61,28.09 33.96,26.44 33.96,21.82 R7.2 R1.1 33.85,20.4 29.77,20.4
  Top 0.508: LDO.2 26.86,20.53 C13.1 29.63,20.53 C7.1 | LDO.2 26.9,20.57 | U$11.3.3V 16.29,30.86 26.31,30.86 26.9,30.28 26.9,20.57 LDO.2
  Bottom 0.254: TAG-ICSP.2 v39.37,39.24
VUSB  (via drill 0.38)
  Top 0.254: C8.2 17.45,22.3 MCP73831.4
  Top 0.381: USB_TOP.VBUS 26.2,5.6 26.82,6.22 v26.82,9.75 | v17.75,23.42 17.39,23.18 17.39,22.64 MCP73831.4
  Top 0.762: v17.75,23.42 v16.99,23.42 | v26.29,10.29 v26.82,9.75
  Bottom 0.381: v16.99,23.42 17.35,23.24 17.32,20.42 17.32,19.25 v26.29,10.29
  Bottom 0.762: v17.75,23.42 v16.99,23.42 | v26.29,10.29 v26.82,9.75

### Text on the board
Top: Duress | 11'23
tPlace: - | +
tStop: Duress